# Altium project USB 7-Port Hub Breakout V1.PrjPcb
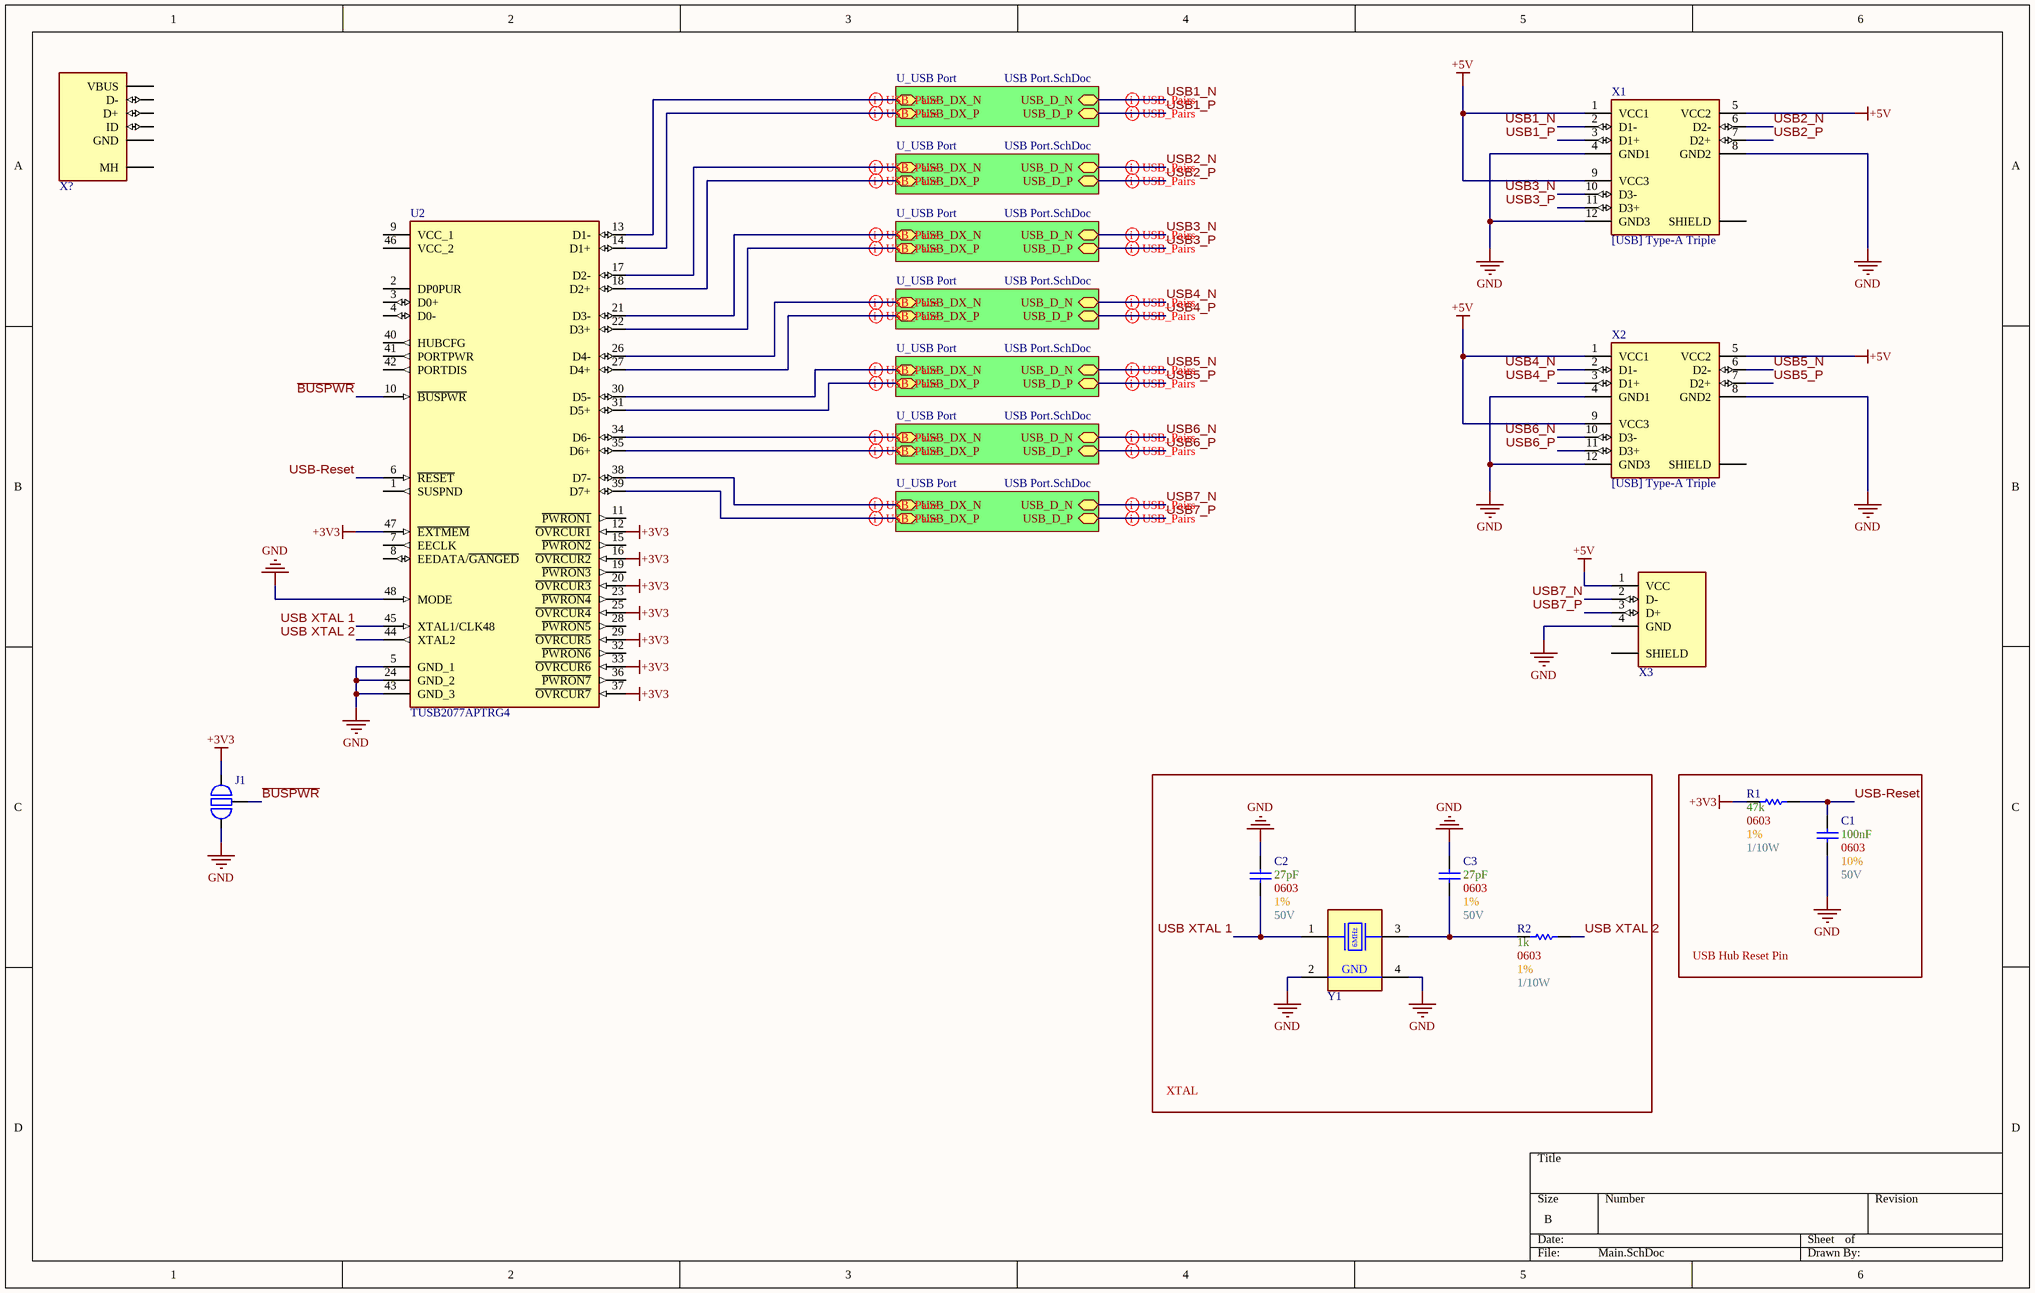
[diagram p0: Main.SchDoc]
2 sheets, 54 parts. Net scope: hierarchical (ports join the sheet entries above them; power ports are global).
Sheets:
  Main.SchDoc
    U_USB Port = USB Port.SchDoc
    U_USB Port = USB Port.SchDoc
    U_USB Port = USB Port.SchDoc
    U_USB Port = USB Port.SchDoc
    U_USB Port = USB Port.SchDoc
    U_USB Port = USB Port.SchDoc
    U_USB Port = USB Port.SchDoc

## Sheet Main.SchDoc
size B; SheetNumber: 1; SheetTotal: 2

### Parts
C1  Max Voltage: 50V  Size Package: 0603  Tolerance: 10%  Capacitance: 100nF  [[Cap] SMD 0603]  (hidden comment: [Cap] 0603 0.1uF 10% 50V)
C2  Max Voltage: 50V  Size Package: 0603  Tolerance: 1%  Capacitance: 27pF  [[Cap] SMD 0603]  (hidden comment: [Cap] 0603 27pF 1% 50V)
C3  Max Voltage: 50V  Size Package: 0603  Tolerance: 1%  Capacitance: 27pF  [[Cap] SMD 0603]  (hidden comment: [Cap] 0603 27pF 1% 50V)
J1  [Jumper] Thru-Hole 3pin  [[Jumper] Thru-Hole 3pin]  (value not drawn)  (no BOM)
R1  Wattage: 1/10W  Tolerance: 1%  Resistance: 47k  Size Package: 0603  [[Res] SMD 0603]  (hidden comment: [47k] SMD 0603 1% 1/10W)
R2  Wattage: 1/10W  Tolerance: 1%  Resistance: 1k  Size Package: 0603  [[Res] SMD 0603]  (hidden comment: [1k] SMD 0603 1% 1/10W)
U2  TUSB2077APTRG4  [48-LQFP (7x7)]
X1  [USB] Type-A Triple  [[USB] Type-A Triple]
X2  [USB] Type-A Triple  [[USB] Type-A Triple]
X3  USB-A  [[USB] Type-A]  (value not drawn)
X?  [USB] Type-B Mini  [[USB] Type-B Mini]  (value not drawn)
Y1  [Crystal] SMD 6MHz  [[Crystal] SMD 6MHz]  (value not drawn)

### Blocks framed on the sheet
XTAL: C2 C3 R2 Y1
USB Hub Reset Pin: C1 R1

### Sub-sheets
U_USB Port = USB Port.SchDoc: USB_DX_P (bidir), USB_DX_N (bidir), USB_D_P (bidir), USB_D_N (bidir)
U_USB Port = USB Port.SchDoc: USB_DX_P (bidir), USB_DX_N (bidir), USB_D_P (bidir), USB_D_N (bidir)
U_USB Port = USB Port.SchDoc: USB_DX_P (bidir), USB_DX_N (bidir), USB_D_P (bidir), USB_D_N (bidir)
U_USB Port = USB Port.SchDoc: USB_DX_P (bidir), USB_DX_N (bidir), USB_D_P (bidir), USB_D_N (bidir)
U_USB Port = USB Port.SchDoc: USB_DX_P (bidir), USB_DX_N (bidir), USB_D_P (bidir), USB_D_N (bidir)
U_USB Port = USB Port.SchDoc: USB_DX_P (bidir), USB_DX_N (bidir), USB_D_P (bidir), USB_D_N (bidir)
U_USB Port = USB Port.SchDoc: USB_DX_P (bidir), USB_DX_N (bidir), USB_D_P (bidir), USB_D_N (bidir)

### Nets
+3V3: J1.1 R1.1 U2.12(~{OVRCUR1}) U2.16(~{OVRCUR2}) U2.20(~{OVRCUR3}) U2.25(~{OVRCUR4}) U2.29(~{OVRCUR5}) U2.33(~{OVRCUR6}) U2.37(~{OVRCUR7}) U2.47(~{EXTMEM})
+5V: X1.1(VCC1) X1.5(VCC2) X1.9(VCC3) X2.1(VCC1) X2.5(VCC2) X2.9(VCC3) X3.1(VCC)
GND: C1.1 C2.1 C3.1 J1.3 U2.5(GND_1) U2.24(GND_2) U2.43(GND_3) U2.48(MODE) X1.4(GND1) X1.8(GND2) X1.12(GND3) X2.4(GND1) X2.8(GND2) X2.12(GND3) X3.4(GND) Y1.2(GND) Y1.4(GND)
~{BUSPWR}: J1.2(Common) U2.10(~{BUSPWR})
USB1_N: X1.2(D1-) ; sheet U_USB Port/USB_D_N
USB1_P: X1.3(D1+) ; sheet U_USB Port/USB_D_P
USB2_N: X1.6(D2-) ; sheet U_USB Port/USB_D_N
USB2_P: X1.7(D2+) ; sheet U_USB Port/USB_D_P
USB3_N: X1.10(D3-) ; sheet U_USB Port/USB_D_N
USB3_P: X1.11(D3+) ; sheet U_USB Port/USB_D_P
USB4_N: X2.2(D1-) ; sheet U_USB Port/USB_D_N
USB4_P: X2.3(D1+) ; sheet U_USB Port/USB_D_P
USB5_N: X2.6(D2-) ; sheet U_USB Port/USB_D_N
USB5_P: X2.7(D2+) ; sheet U_USB Port/USB_D_P
USB6_N: X2.10(D3-) ; sheet U_USB Port/USB_D_N
USB6_P: X2.11(D3+) ; sheet U_USB Port/USB_D_P
USB7_N: X3.2(D-) ; sheet U_USB Port/USB_D_N
USB7_P: X3.3(D+) ; sheet U_USB Port/USB_D_P
USB XTAL 1: C2.2 U2.45(XTAL1/CLK48) Y1.1(XTAL1)
USB XTAL 2: R2.2 U2.44(XTAL2)
USB-Reset: C1.2 R1.2 U2.6(~{RESET})
USB_DX_N: U2.13(D1-) ; sheet U_USB Port/USB_DX_N
USB_DX_N: U2.17(D2-) ; sheet U_USB Port/USB_DX_N  [a separate net that carries the same name]
USB_DX_N: U2.21(D3-) ; sheet U_USB Port/USB_DX_N  [a separate net that carries the same name]
USB_DX_N: U2.34(D6-) ; sheet U_USB Port/USB_DX_N  [a separate net that carries the same name]
USB_DX_N: U2.30(D5-) ; sheet U_USB Port/USB_DX_N  [a separate net that carries the same name]
USB_DX_N: U2.26(D4-) ; sheet U_USB Port/USB_DX_N  [a separate net that carries the same name]
USB_DX_N: U2.38(D7-) ; sheet U_USB Port/USB_DX_N  [a separate net that carries the same name]
USB_DX_P: U2.14(D1+) ; sheet U_USB Port/USB_DX_P
USB_DX_P: U2.18(D2+) ; sheet U_USB Port/USB_DX_P  [a separate net that carries the same name]
USB_DX_P: U2.22(D3+) ; sheet U_USB Port/USB_DX_P  [a separate net that carries the same name]
USB_DX_P: U2.35(D6+) ; sheet U_USB Port/USB_DX_P  [a separate net that carries the same name]
USB_DX_P: U2.31(D5+) ; sheet U_USB Port/USB_DX_P  [a separate net that carries the same name]
USB_DX_P: U2.27(D4+) ; sheet U_USB Port/USB_DX_P  [a separate net that carries the same name]
USB_DX_P: U2.39(D7+) ; sheet U_USB Port/USB_DX_P  [a separate net that carries the same name]
NetC3_2: C3.2 R2.1 Y1.3(XTAL2)

Not connected (* = marked no-connect by the designer): U2 1(SUSPND) 2(DP0PUR) 3(D0+) 4(D0-) 7(EECLK) 8(EEDATA/~{GANGED}) 9(VCC_1) 11(~{PWRON1}) 15(~{PWRON2}) 19(~{PWRON3}) 23(~{PWRON4}) 28(~{PWRON5}) 32(~{PWRON6}) 36(~{PWRON7}) 40(HUBCFG) 41(PORTPWR) 42(PORTDIS) 46(VCC_2); X1 MH(SHIELD); X2 MH(SHIELD); X3 MH(SHIELD); X? 1(VBUS) 2(D-) 3(D+) 4(ID) 5(GND) MH

### Layout directives
differential pair; differential pair class USB_Pairs: USB1_N, USB1_P, USB2_N, USB2_P, USB3_N, USB3_P, USB4_N, USB4_P, USB5_N, USB5_P, USB6_N, USB6_P, USB7_N, USB7_P, USB_DX_N, USB_DX_P

### Notes on the sheet
- (in symbol [Crystal] SMD 6MHz) 6MHz

### Library data of the parts
C1 = [Cap] 0603 0.1uF 10% 50V: CL10B104KB8NNNC; Supplier 1: DigiKey; Supplier Part Number 1: 1276-1000-6-ND
C2 C3 = [Cap] 0603 27pF 1% 50V: 0603N270F500CT; Supplier 1: DigiKey; Supplier Part Number 1: 1292-1510-1-ND
R1 = [47k] SMD 0603 1% 1/10W: RC0603FR-0747KL; Supplier 1: DigiKey; Supplier Part Number 1: 311-47.0KHRDKR-ND
R2 = [1k] SMD 0603 1% 1/10W: RMCF0603FT1K00; Supplier 1: DigiKey; Supplier Part Number 1: RMCF0603FT1K00DKR-ND
U2 = [USB Hub] 2.0 7port: TUSB2077APTR; Supplier 1: DigiKey; Supplier Part Number 1: 296-37871-6-ND
X1 X2 = [USB] Type-A Triple: 1002-012-01020; Supplier 1: DigiKey; Supplier Part Number 1: 1175-1002-012-01020-ND
X3 = [USB] Type-A: KUSBEX-ASFS1N-B; Supplier 1: DigiKey; Supplier Part Number 1: 2092-KUSBEX-ASFS1N-B-ND
X? = [USB] Type-B Mini: MUSB-05-S-B-SM-A-K-TR; Supplier 1: DigiKey; Supplier Part Number 1: SAM14226CT-ND
Y1 = [Crystal] SMD 6MHz: ECS-060-18-20BM-JEN-TR; Supplier 1: DigiKey; Supplier Part Number 1: XC2349DKR-ND

## Sheet USB Port.SchDoc
size A; SheetNumber: 2; SheetTotal: 2
Used 7 times, as channels U_USB Port, U_USB Port, U_USB Port, U_USB Port, U_USB Port, U_USB Port, U_USB Port. Parts and nets are listed once, with the designators drawn on the sheet.
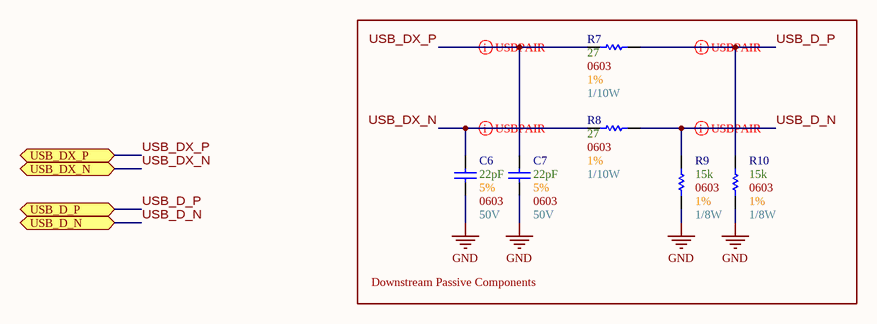
[diagram p1: USB Port.SchDoc]

### Parts
C6  Max Voltage: 50V  Size Package: 0603  Tolerance: 5%  Capacitance: 22pF  [[Cap] SMD 0603]  (hidden comment: [Cap] 0603 22pF 5% 50V)
C7  Max Voltage: 50V  Size Package: 0603  Tolerance: 5%  Capacitance: 22pF  [[Cap] SMD 0603]  (hidden comment: [Cap] 0603 22pF 5% 50V)
R7  Wattage: 1/10W  Tolerance: 1%  Resistance: 27  Size Package: 0603  [[Res] SMD 0603]  (hidden comment: [27] SMD 0603 1% 1/10W)
R8  Wattage: 1/10W  Tolerance: 1%  Resistance: 27  Size Package: 0603  [[Res] SMD 0603]  (hidden comment: [27] SMD 0603 1% 1/10W)
R9  Wattage: 1/8W  Tolerance: 1%  Resistance: 15k  Size Package: 0603  [[Res] SMD 0603]  (hidden comment: [15k] SMD 0603 1% 1/8W)
R10  Wattage: 1/8W  Tolerance: 1%  Resistance: 15k  Size Package: 0603  [[Res] SMD 0603]  (hidden comment: [15k] SMD 0603 1% 1/8W)

### Blocks framed on the sheet
Downstream Passive Components: C6 C7 R7-R10

### Ports
USB_D_N (bidir), USB_D_P (bidir), USB_DX_N (bidir), USB_DX_P (bidir)

### Nets
GND: C6.1 C7.1 R9.1 R10.1
USB_D_N: R8.2 R9.2 ; port USB_D_N
USB_D_P: R7.2 R10.2 ; port USB_D_P
USB_DX_N: C6.2 R8.1 ; port USB_DX_N
USB_DX_P: C7.2 R7.1 ; port USB_DX_P

### Channels
U_USB Port: designators end in _U_USB_Port#1; ports USB_D_N=USB1_N USB_D_P=USB1_P USB_DX_N=USB_DX_N USB_DX_P=USB_DX_P
U_USB Port: designators end in _U_USB_Port#2; ports USB_D_N=USB2_N USB_D_P=USB2_P USB_DX_N=USB_DX_N USB_DX_P=USB_DX_P
U_USB Port: designators end in _U_USB_Port#3; ports USB_D_N=USB3_N USB_D_P=USB3_P USB_DX_N=USB_DX_N USB_DX_P=USB_DX_P
U_USB Port: designators end in _U_USB_Port#4; ports USB_D_N=USB4_N USB_D_P=USB4_P USB_DX_N=USB_DX_N USB_DX_P=USB_DX_P
U_USB Port: designators end in _U_USB_Port#5; ports USB_D_N=USB5_N USB_D_P=USB5_P USB_DX_N=USB_DX_N USB_DX_P=USB_DX_P
U_USB Port: designators end in _U_USB_Port#6; ports USB_D_N=USB6_N USB_D_P=USB6_P USB_DX_N=USB_DX_N USB_DX_P=USB_DX_P
U_USB Port: designators end in _U_USB_Port#7; ports USB_D_N=USB7_N USB_D_P=USB7_P USB_DX_N=USB_DX_N USB_DX_P=USB_DX_P

### Layout directives
differential pair; differential pair class USB_Pairs: USB1_N, USB1_P, USB_DX_N, USB_DX_P

### Library data of the parts
C6 C7 = [Cap] 0603 22pF 5% 50V: CC0603JRNPO9BN240; Supplier 1: DigiKey; Supplier Part Number 1: 311-1062-1-ND
R7 R8 = [27] SMD 0603 1% 1/10W: MCT06030C2709FP500; Supplier 1: DigiKey; Supplier Part Number 1: 749-1631-1-ND
R9 R10 = [15k] SMD 0603 1% 1/8W: CRCW060315K0FKEA; Supplier 1: DigiKey; Supplier Part Number 1: 541-15.0KHCT-ND

## Nets that join several sheets
GND: Main (17 pins), U_USB Port (C6_U_USB_Port#1.1 C7_U_USB_Port#1.1 R9_U_USB_Port#1.1 R10_U_USB_Port#1.1), U_USB Port (C6_U_USB_Port#2.1 C7_U_USB_Port#2.1 R9_U_USB_Port#2.1 R10_U_USB_Port#2.1), U_USB Port (C6_U_USB_Port#3.1 C7_U_USB_Port#3.1 R9_U_USB_Port#3.1 R10_U_USB_Port#3.1), U_USB Port (C6_U_USB_Port#4.1 C7_U_USB_Port#4.1 R9_U_USB_Port#4.1 R10_U_USB_Port#4.1), U_USB Port (C6_U_USB_Port#5.1 C7_U_USB_Port#5.1 R9_U_USB_Port#5.1 R10_U_USB_Port#5.1), U_USB Port (C6_U_USB_Port#6.1 C7_U_USB_Port#6.1 R9_U_USB_Port#6.1 R10_U_USB_Port#6.1), U_USB Port (C6_U_USB_Port#7.1 C7_U_USB_Port#7.1 R9_U_USB_Port#7.1 R10_U_USB_Port#7.1)
USB1_N: Main (X1.2), U_USB Port (R8_U_USB_Port#1.2 R9_U_USB_Port#1.2)
USB1_P: Main (X1.3), U_USB Port (R7_U_USB_Port#1.2 R10_U_USB_Port#1.2)
USB2_N: Main (X1.6), U_USB Port (R8_U_USB_Port#2.2 R9_U_USB_Port#2.2)
USB2_P: Main (X1.7), U_USB Port (R7_U_USB_Port#2.2 R10_U_USB_Port#2.2)
USB3_N: Main (X1.10), U_USB Port (R8_U_USB_Port#3.2 R9_U_USB_Port#3.2)
USB3_P: Main (X1.11), U_USB Port (R7_U_USB_Port#3.2 R10_U_USB_Port#3.2)
USB4_N: Main (X2.2), U_USB Port (R8_U_USB_Port#4.2 R9_U_USB_Port#4.2)
USB4_P: Main (X2.3), U_USB Port (R7_U_USB_Port#4.2 R10_U_USB_Port#4.2)
USB5_N: Main (X2.6), U_USB Port (R8_U_USB_Port#5.2 R9_U_USB_Port#5.2)
USB5_P: Main (X2.7), U_USB Port (R7_U_USB_Port#5.2 R10_U_USB_Port#5.2)
USB6_N: Main (X2.10), U_USB Port (R8_U_USB_Port#6.2 R9_U_USB_Port#6.2)
USB6_P: Main (X2.11), U_USB Port (R7_U_USB_Port#6.2 R10_U_USB_Port#6.2)
USB7_N: Main (X3.2), U_USB Port (R8_U_USB_Port#7.2 R9_U_USB_Port#7.2)
USB7_P: Main (X3.3), U_USB Port (R7_U_USB_Port#7.2 R10_U_USB_Port#7.2)
USB_DX_N: Main (U2.13), U_USB Port (C6_U_USB_Port#1.2 R8_U_USB_Port#1.1)
USB_DX_N: Main (U2.17), U_USB Port (C6_U_USB_Port#2.2 R8_U_USB_Port#2.1)
USB_DX_N: Main (U2.21), U_USB Port (C6_U_USB_Port#3.2 R8_U_USB_Port#3.1)
USB_DX_N: Main (U2.34), U_USB Port (C6_U_USB_Port#6.2 R8_U_USB_Port#6.1)
USB_DX_N: Main (U2.30), U_USB Port (C6_U_USB_Port#5.2 R8_U_USB_Port#5.1)
USB_DX_N: Main (U2.26), U_USB Port (C6_U_USB_Port#4.2 R8_U_USB_Port#4.1)
USB_DX_N: Main (U2.38), U_USB Port (C6_U_USB_Port#7.2 R8_U_USB_Port#7.1)
USB_DX_P: Main (U2.14), U_USB Port (C7_U_USB_Port#1.2 R7_U_USB_Port#1.1)
USB_DX_P: Main (U2.18), U_USB Port (C7_U_USB_Port#2.2 R7_U_USB_Port#2.1)
USB_DX_P: Main (U2.22), U_USB Port (C7_U_USB_Port#3.2 R7_U_USB_Port#3.1)
USB_DX_P: Main (U2.35), U_USB Port (C7_U_USB_Port#6.2 R7_U_USB_Port#6.1)
USB_DX_P: Main (U2.31), U_USB Port (C7_U_USB_Port#5.2 R7_U_USB_Port#5.1)
USB_DX_P: Main (U2.27), U_USB Port (C7_U_USB_Port#4.2 R7_U_USB_Port#4.1)
USB_DX_P: Main (U2.39), U_USB Port (C7_U_USB_Port#7.2 R7_U_USB_Port#7.1)